# Altium schematic sheet RS485_LoRa_Gateway_2.SchDoc
size A4; SheetNumber: 2; SheetTotal: 3
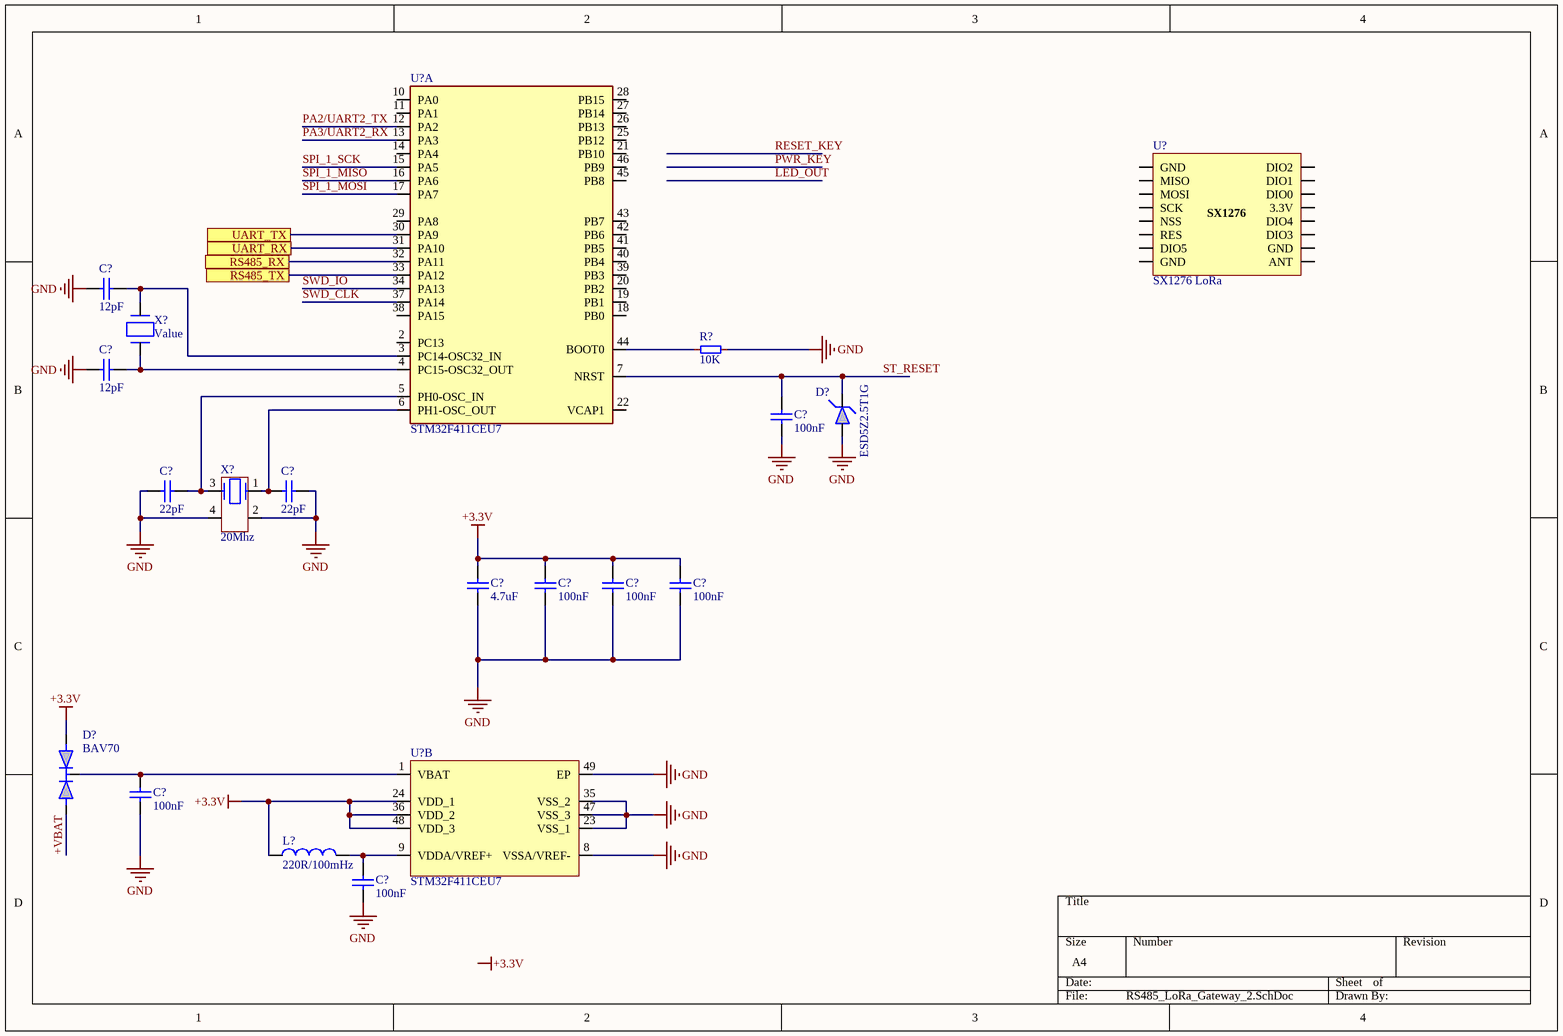
[diagram p0: RS485_LoRa_Gateway_2.SchDoc]

## Parts
(Parts that share a designator on the sheet are numbered #1, #2 ... from top to bottom, then left to right.)
C?#1  12pF  [CAP0402]
C?#2  12pF  [CAP0402]
C?#3  100nF  [CAP0402]
C?#4  22pF  [CAP0402]
C?#5  22pF  [CAP0402]
C?#6  4.7uF  [CAP0603]
C?#7  100nF  [CAP0402]
C?#8  100nF  [CAP0402]
C?#9  100nF  [CAP0402]
C?#10  100nF  [CAP0402]
C?#11  100nF  [CAP0402]
D?#1  ESD5Z2.5T1G  [SOD523]
D?#2  BAV70  [SOT23-3]
L?  220R/100mHz  [IND_0603]
R?  10K  [RESC0402]
U?#1  STM32F411CEU7  [QFN48]  (part A of 2)
U?#2  SX1276 LoRa  [RFM95]
U?#3  STM32F411CEU7  [QFN48]  (part B of 2)
X?#1  32.768kHz  [OSC_3215]  (value not drawn)
X?#2  20Mhz  [OSC_3225]

## Ports
RS485_RX (see RS485_LoRa_Gateway_1[1A]), RS485_TX (see RS485_LoRa_Gateway_1[1A]), UART_RX (see RS485_LoRa_Gateway_3[5C]), UART_TX (see RS485_LoRa_Gateway_3[6C])

## Nets
+3.3V: C?#6.2 C?#7.2 C?#8.2 C?#9.2 D?#2.1 L?.1 U?#3.24(VDD_1) U?#3.36(VDD_2) U?#3.48(VDD_3)
GND: C?#1.2 C?#2.2 C?#3.1 C?#4.2 C?#5.1 C?#6.1 C?#7.1 C?#8.1 C?#9.1 C?#10.1 C?#11.1 D?#1.2(A) R?.1 U?#3.8(VSSA/VREF-) U?#3.23(VSS_1) U?#3.35(VSS_2) U?#3.47(VSS_3) U?#3.49(EP) X?#2.2 X?#2.4
+VBAT: D?#2.2
PA2/UART2_TX: U?#1.12(PA2)
PA3/UART2_RX: U?#1.13(PA3)
RS485_RX: U?#1.32(PA11) ; port RS485_RX
RS485_TX: U?#1.33(PA12) ; port RS485_TX
SPI_1_MISO: U?#1.16(PA6)
SPI_1_MOSI: U?#1.17(PA7)
SPI_1_SCK: U?#1.15(PA5)
ST_RESET: C?#3.2 D?#1.1(K) U?#1.7(NRST)
SWD_CLK: U?#1.37(PA14)
SWD_IO: U?#1.34(PA13)
UART_RX: U?#1.31(PA10) ; port UART_RX
UART_TX: U?#1.30(PA9) ; port UART_TX
NetC?#1_1: C?#1.1 U?#1.3(PC14-OSC32_IN) X?#1.2(X2)
NetC?#2_1: C?#2.1 U?#1.4(PC15-OSC32_OUT) X?#1.1(X1)
NetC?#4_1: C?#4.1 U?#1.5(PH0-OSC_IN) X?#2.3
NetC?#5_2: C?#5.2 U?#1.6(PH1-OSC_OUT) X?#2.1
NetC?#10_2: C?#10.2 D?#2.3 U?#3.1(VBAT)
NetC?#11_2: C?#11.2 L?.2 U?#3.9(VDDA/VREF+)
NetR?_2: R?.2 U?#1.44(BOOT0)

Not connected (* = marked no-connect by the designer): U?#1 2(PC13) 10(PA0) 11(PA1) 14(PA4) 18(PB0) 19(PB1) 20(PB2) 21(PB10) 22(VCAP1) 25(PB12) 26(PB13) 27(PB14) 28(PB15) 29(PA8) 38(PA15) 39(PB3) 40(PB4) 41(PB5) 42(PB6) 43(PB7) 45(PB8) 46(PB9); U?#2 1(GND) 2(MISO) 3(MOSI) 4(SCK) 5(NSS) 6(RES) 7(DIO5) 8(GND) 9(ANT) 10(GND) 11(DIO3) 12(DIO4) 13(3.3V) 14(DIO0) 15(DIO1) 16(DIO2)

## Notes on the sheet
- Labels drawn without touching a wire or pin: +3.3V
- (in symbol SX1276 LoRa) SX1276

## Library data of the parts
C?#1 C?#2 = CAP_0402: Ceramic Capacitor NP0 0402 12pF 50V; Manufacturer_Part_Number: GRM1555C1H120GA01D; Manufacturer: MURATA; Supplier: *; Package: 0402; Price: *
C?#3 C?#7-C?#11 = Capa_0402: Ceramic Capacitor C0G, NP0 0402 100nF 35V; Manufacturer_Part_Number: GRM155R61A104KA01J; Manufacturer: MURATA
C?#4 C?#5 = CAP_0402: Ceramic Capacitor NP0 0402 22pF 50V; Manufacturer_Part_Number: GRM1555C1H220GA01D; Manufacturer: MURATA; Supplier: *; Package: 0402; Price: *
C?#6 = Capa_0603: MLCC - SMD/SMT 4.7 uF 16 VDC 10% 0603 X5R; Manufacturer_Part_Number: CL10A475KQ8NNNC; Manufacturer: Samsung Electro-Mechanics
D?#1 = DIODE-ESD: ESD Protection Diodes / TVS Diodes 2.5V ESD Protection Unidirectional; Manufacturer: onsemi; Manufacturer_Part_Number: ESD5Z2.5T1G
D?#2 = BAV70: BAV70 Dual Small Signal Switching Diode; Manufacturer: Generic; Manufacturer_Part_Number: BAV70; Package: SOT-23; Supplier: Mouser
L? = IND_0603: 700mA 220R 100mHz Feride bead 0603; Manufacturer: MURATA; Manufacturer_Part_Number: BLM18AG221SN1D; Value: *; Package: 0603; Price: *; Supplier: MOUSER/ROBU
R? = RES_0402: Thick Film Resistors - SMD 1/16watt 10Kohms 0402 1% Commercial Use; Manufacturer_Part_Number: CRCW040210K0FKEDC; Manufacturer: Vishay; Parameter 1: *
U?#1 U?#3 = STM32F411CEU7: ARM Microcontrollers - MCU High-performance access line, Arm Cortex-M4 core DSP & FPU, 512 Kbytes of Flash; Manufacturer: STMicroelectronics; Manufacturer_Part_Number: STM32F411CEU7; Package: UFQFPN-48
U?#2 = SX1276 LoRa: SX1276 LoRa SMD
X?#1 = OSC_3215: Crystal Osc 3215 2Pin 32.768kHz 2Pin 9pF; Manufacturer_Part_Number: *; Manufacturer: *; Package: 3215; Value: Value
X?#2 = OSC_3225: Crystal Osc 3225 4 Pin 20Mhz 20pF; Manufacturer_Part_Number: X322520MSB4SI; Manufacturer: YXC; Package: 3225; Price: *; Value: 20Mhz